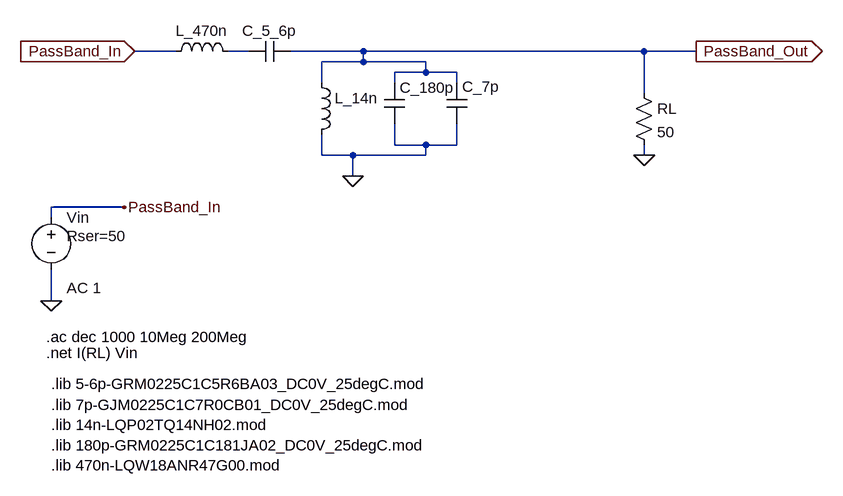
[diagram p0: schematic passaBanda98MHz.asc]
passaBanda98MHz.asc, the LTspice schematic file:
Version 4.1
SHEET 1 1012 804
WIRE -16 160 -80 160
WIRE 96 160 64 160
WIRE 272 160 160 160
WIRE 704 160 272 160
WIRE 784 160 704 160
WIRE 272 176 272 160
WIRE 272 176 208 176
WIRE 368 176 272 176
WIRE 368 192 368 176
WIRE 368 192 320 192
WIRE 416 192 368 192
WIRE 208 208 208 176
WIRE 320 208 320 192
WIRE 416 208 416 192
WIRE 704 224 704 160
WIRE 320 304 320 272
WIRE 368 304 320 304
WIRE 416 304 416 272
WIRE 416 304 368 304
WIRE 208 320 208 288
WIRE 256 320 208 320
WIRE 368 320 368 304
WIRE 368 320 256 320
WIRE 704 320 704 304
WIRE 256 352 256 320
WIRE -96 400 -208 400
WIRE -208 416 -208 400
WIRE -208 544 -208 496
FLAG 256 352 0
FLAG -80 160 PassBand_In
IOPIN -80 160 In
FLAG 784 160 PassBand_Out
IOPIN 784 160 Out
FLAG -208 544 0
FLAG -96 400 PassBand_In
FLAG 704 320 0
SYMBOL ind -32 176 R270
WINDOW 0 32 56 VTop 2
WINDOW 3 5 56 Invisible 2
SYMATTR InstName L_470n
SYMATTR Value LQW18ANR47G00
SYMATTR Prefix X
SYMBOL ind 192 192 R0
WINDOW 3 36 80 Invisible 2
SYMATTR InstName L_14n
SYMATTR Value LQP02TQ14NH02
SYMATTR Prefix X
SYMBOL cap 160 144 R90
WINDOW 0 0 32 VBottom 2
WINDOW 3 32 32 Invisible 2
SYMATTR InstName C_5_6p
SYMATTR Value GRM0225C1C5R6BA03_DC0V_25degC
SYMATTR Prefix X
SYMBOL cap 304 208 R0
WINDOW 3 24 56 Invisible 2
SYMATTR InstName C_180p
SYMATTR Value GRM0225C1C181JA02_DC0V_25degC
SYMATTR Prefix X
SYMBOL voltage -208 400 R0
WINDOW 123 24 124 Left 2
WINDOW 39 24 44 Left 2
SYMATTR Value2 AC 1
SYMATTR SpiceLine Rser=50
SYMATTR InstName Vin
SYMATTR Value ""
SYMBOL res 688 208 R0
SYMATTR InstName RL
SYMATTR Value 50
SYMBOL cap 400 208 R0
WINDOW 0 53 22 Bottom 2
WINDOW 3 24 56 Invisible 2
SYMATTR InstName C_7p
SYMATTR Value GJM0225C1C7R0CB01_DC0V_25degC
SYMATTR Prefix X
TEXT -216 600 Left 2 !.ac dec 1000 10Meg 200Meg
TEXT -216 624 Left 2 !.net I(RL) Vin
TEXT -208 672 Left 2 !.lib 5-6p-GRM0225C1C5R6BA03_DC0V_25degC.mod
TEXT -208 704 Left 2 !.lib 7p-GJM0225C1C7R0CB01_DC0V_25degC.mod\n.lib 14n-LQP02TQ14NH02.mod\n.lib 180p-GRM0225C1C181JA02_DC0V_25degC.mod\n.lib 470n-LQW18ANR47G00.mod

The netlist it stands for:
* passaBanda98MHz.asc
X§L_470n PassBand_In N001 LQW18ANR47G00  ; pins A B
X§L_14n PassBand_Out 0 LQP02TQ14NH02  ; pins A B
X§C_5_6p PassBand_Out N001 GRM0225C1C5R6BA03_DC0V_25degC  ; pins A B
X§C_180p PassBand_Out 0 GRM0225C1C181JA02_DC0V_25degC  ; pins A B
Vin PassBand_In 0 AC 1 Rser=50
RL PassBand_Out 0 50
X§C_7p PassBand_Out 0 GJM0225C1C7R0CB01_DC0V_25degC  ; pins A B
.ac dec 1000 10Meg 200Meg
.net I(RL) Vin
.lib 5-6p-GRM0225C1C5R6BA03_DC0V_25degC.mod
.lib 7p-GJM0225C1C7R0CB01_DC0V_25degC.mod
.lib 14n-LQP02TQ14NH02.mod
.lib 180p-GRM0225C1C181JA02_DC0V_25degC.mod
.lib 470n-LQW18ANR47G00.mod
.backanno
.end